# Altium schematic sheet Sheet5.SchDoc
size A3; SheetNumber: 5; SheetTotal: 6
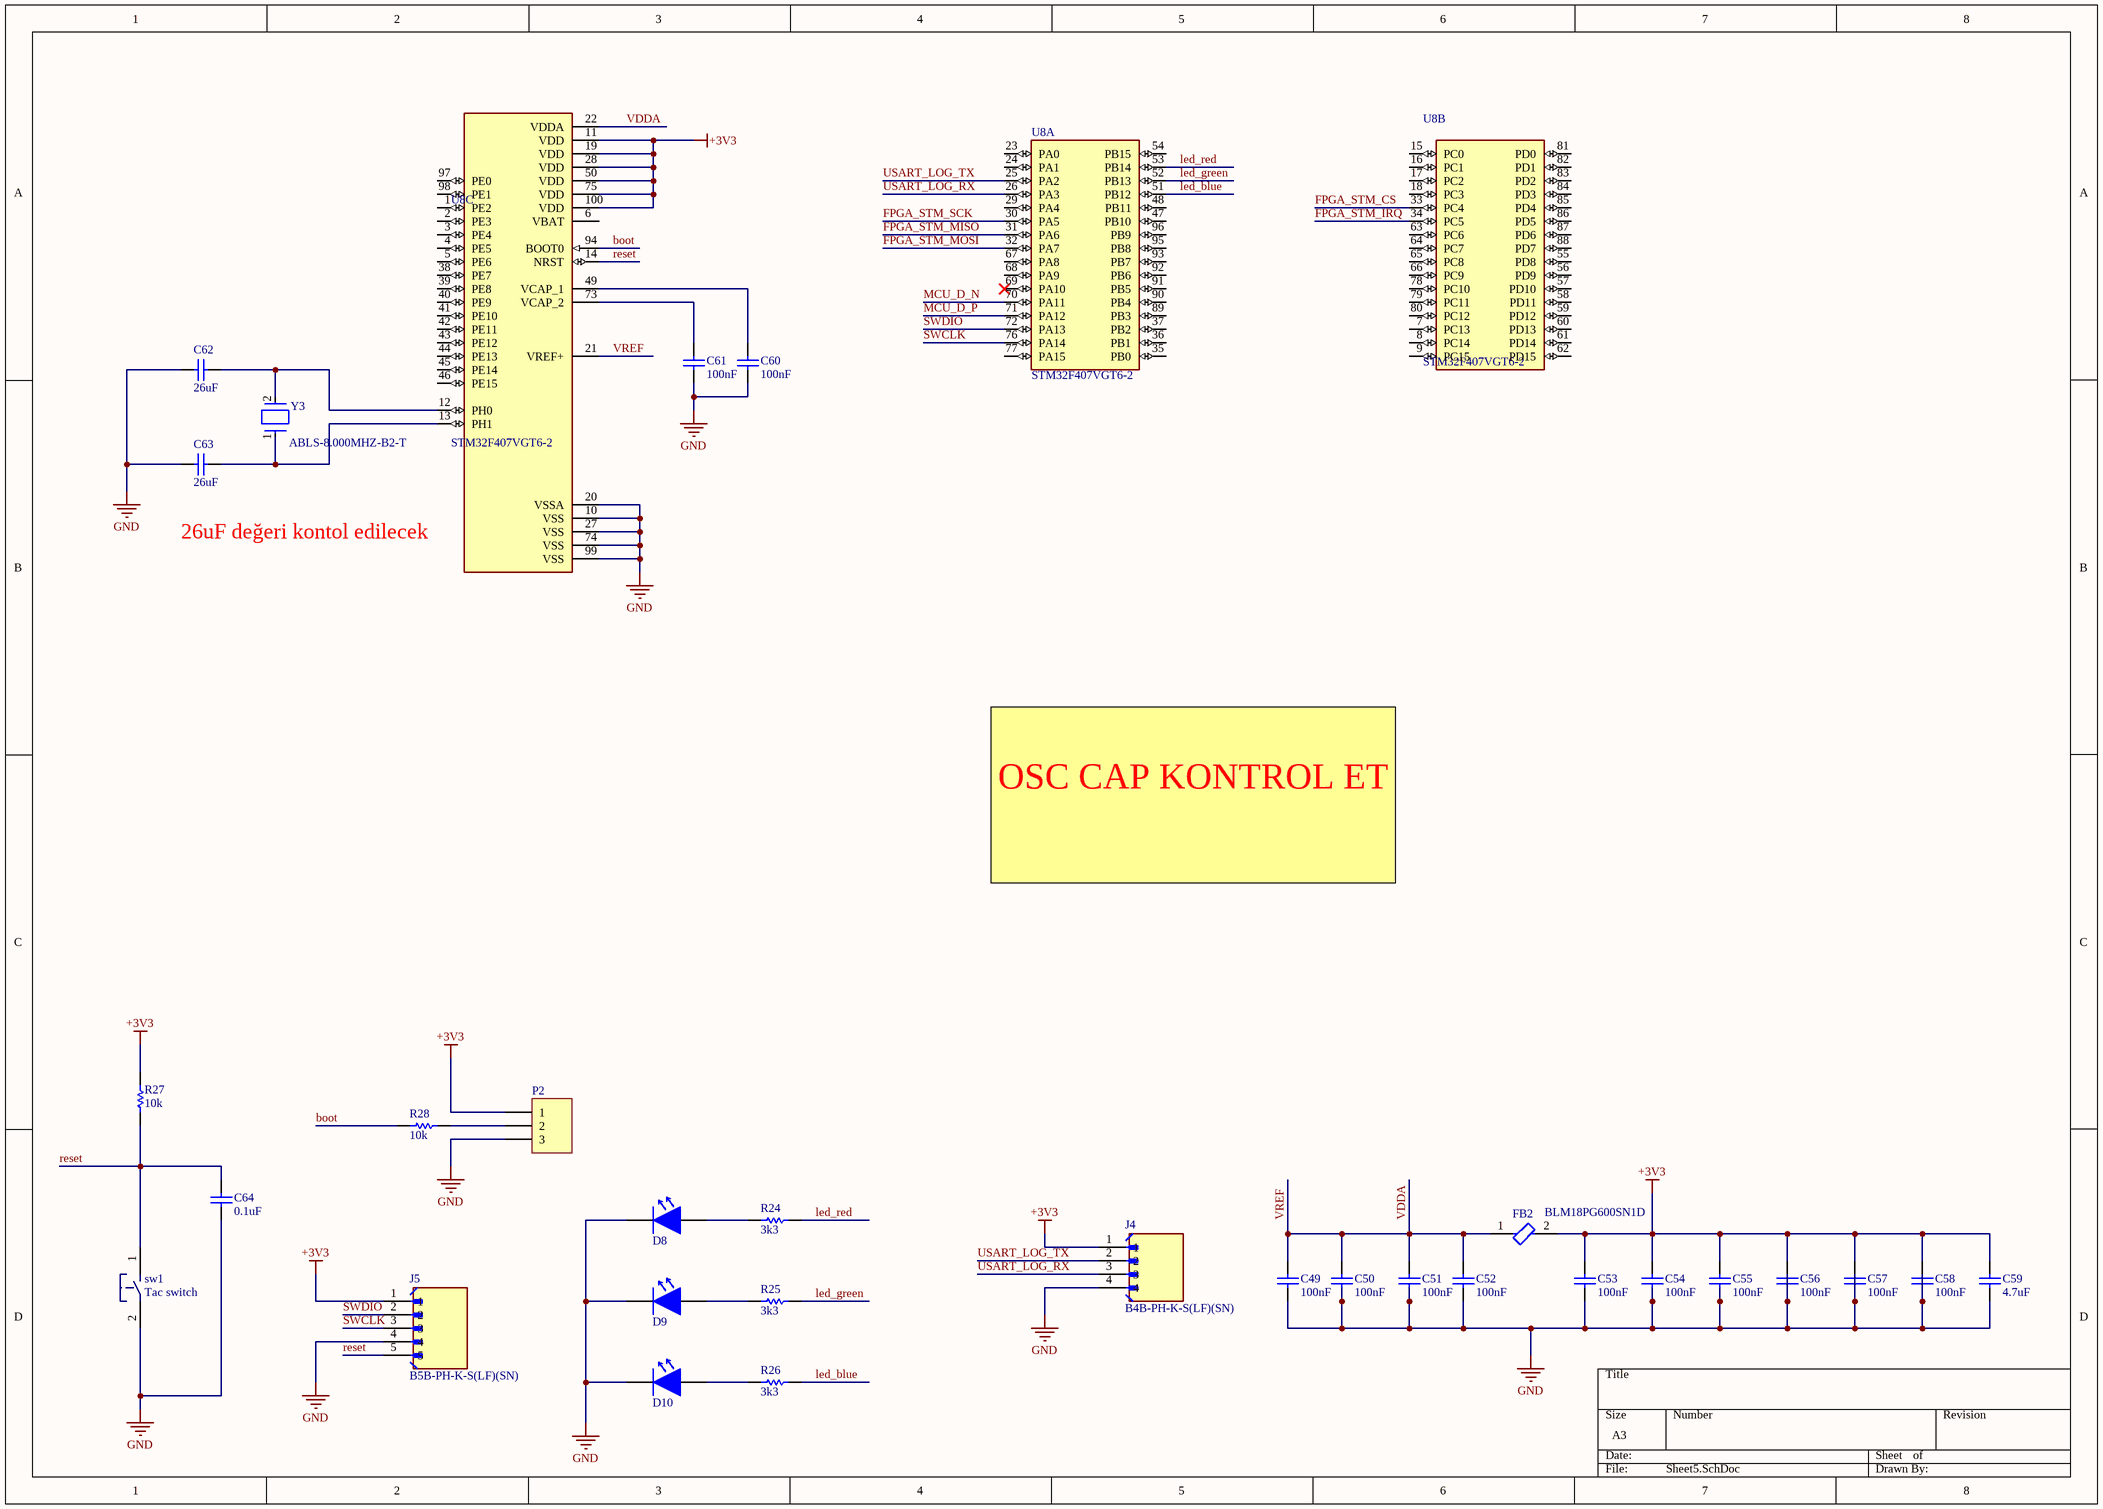
[diagram p0: Sheet5.SchDoc]

## Parts
C49  100nF  [CAPC0603(1608)100_L]
C50  100nF  [CAPC0603(1608)100_L]
C51  100nF  [CAPC0603(1608)100_L]
C52  100nF  [CAPC0603(1608)100_L]
C53  100nF  [CAPC0603(1608)100_L]
C54  100nF  [CAPC0603(1608)100_L]
C55  100nF  [CAPC0603(1608)100_L]
C56  100nF  [CAPC0603(1608)100_L]
C57  100nF  [CAPC0603(1608)100_L]
C58  100nF  [CAPC0603(1608)100_L]
C59  4.7uF  [CAPC0603(1608)100_L]
C60  100nF  [CAPC0603(1608)100_L]
C61  100nF  [CAPC0603(1608)100_L]
C62  26uF  [CAPC0603(1608)100_L]
C63  26uF  [CAPC0603(1608)100_L]
C64  0.1uF  [CAPC0603(1608)100_L]
D8  LH R974-LP-1  [LED_RED_0805]  (value not drawn)
D9  LH R974-LP-1  [LED_RED_0805]  (value not drawn)
D10  LH R974-LP-1  [LED_RED_0805]  (value not drawn)
FB2  BLM18PG600SN1D  [FP-BLM18-0_15-t0_8-IPC_B]
J4  B4B-PH-K-S(LF)(SN)  [JST_B4B-PH-K-S(LF)(SN)]
J5  B5B-PH-K-S(LF)(SN)  [JST_B5B-PH-K-S(LF)(SN)]
P2  Header 3  [My_1X03]  (value not drawn)
R24  3k3  [RESC1005X40X20NL05T10]
R25  3k3  [RESC1005X40X20NL05T10]
R26  3k3  [RESC1005X40X20NL05T10]
R27  10k  [RESC1005X40X20NL05T10]
R28  10k  [RESC1005X40X20NL05T10]
sw1  Tac switch  [MY_TACTILE-PTH]
U8  STM32F407VGT6-2  [LQFP100]  (parts A,B,C of 3)
Y3  ABLS-8.000MHZ-B2-T  [FP-ABLS-MFG]

## Nets
+3V3: C53.1 C54.1 C55.1 C56.1 C57.1 C58.1 C59.1 FB2.2 J4.1 J5.1 P2.1 R27.1 U8.11(VDD) U8.19(VDD) U8.28(VDD) U8.50(VDD) U8.75(VDD) U8.100(VDD)
GND: C49.2 C50.2 C51.2 C52.2 C53.2 C54.2 C55.2 C56.2 C57.2 C58.2 C59.2 C60.2 C61.2 C62.1 C63.1 C64.2 D8.1 D9.1 D10.1 J4.4 J5.4 P2.3 sw1.2 U8.10(VSS) U8.20(VSSA) U8.27(VSS) U8.74(VSS) U8.99(VSS)
boot: R28.1 U8.94(BOOT0)
FPGA_STM_CS: U8.33(PC4)
FPGA_STM_IRQ: U8.34(PC5)
FPGA_STM_MISO: U8.31(PA6)
FPGA_STM_MOSI: U8.32(PA7)
FPGA_STM_SCK: U8.30(PA5)
led_blue: R26.1 U8.51(PB12)
led_green: R25.1 U8.52(PB13)
led_red: R24.1 U8.53(PB14)
MCU_D_N: U8.70(PA11)
MCU_D_P: U8.71(PA12)
reset: C64.1 J5.5 R27.2 sw1.1 U8.14(NRST)
SWCLK: J5.3 U8.76(PA14)
SWDIO: J5.2 U8.72(PA13)
USART_LOG_RX: J4.3 U8.26(PA3)
USART_LOG_TX: J4.2 U8.25(PA2)
VDDA: C49.1 C50.1 C51.1 C52.1 FB2.1 U8.21(VREF+) U8.22(VDDA)  [also labelled VREF]
NetC60_1: C60.1 U8.49(VCAP_1)
NetC61_1: C61.1 U8.73(VCAP_2)
NetC62_2: C62.2 U8.12(PH0) Y3.2
NetC63_2: C63.2 U8.13(PH1) Y3.1
NetD8_2: D8.2 R24.2
NetD9_2: D9.2 R25.2
NetD10_2: D10.2 R26.2
NetP2_2: P2.2 R28.2

Not connected (* = marked no-connect by the designer): U8 1(PE2) 2(PE3) 3(PE4) 4(PE5) 5(PE6) 6(VBAT) 7(PC13) 8(PC14) 9(PC15) 15(PC0) 16(PC1) 17(PC2) 18(PC3) 23(PA0) 24(PA1) 29(PA4) 35(PB0) 36(PB1) 37(PB2) 38(PE7) 39(PE8) 40(PE9) 41(PE10) 42(PE11) 43(PE12) 44(PE13) 45(PE14) 46(PE15) 47(PB10) 48(PB11) 54(PB15) 55(PD8) 56(PD9) 57(PD10) 58(PD11) 59(PD12) 60(PD13) 61(PD14) 62(PD15) 63(PC6) 64(PC7) 65(PC8) 66(PC9) 67(PA8) 68(PA9) 69(PA10)* 77(PA15) 78(PC10) 79(PC11) 80(PC12) 81(PD0) 82(PD1) 83(PD2) 84(PD3) 85(PD4) 86(PD5) 87(PD6) 88(PD7) 89(PB3) 90(PB4) 91(PB5) 92(PB6) 93(PB7) 95(PB8) 96(PB9) 97(PE0) 98(PE1)

## Notes on the sheet
- (near U8) 26uF değeri kontol edilecek
- OSC CAP KONTROL ET

## Library data of the parts
C49-C64 = CMP-1035-02072-1: CAP 2.7nF 16V ±20% 0603 (1608 Metric) Thickness 1mm SMD; Tolerance: Â±20%; Case-Metric: 1608; Case-EIA: 0603; Rated Voltage: 16 V; Technology: SMT; Value: 2.7nF; Max Thickness: 1 mm
D8-D10 = LED RED 0805: LED Uni-Color Hyper Red 660nm 2-Pin Chip 0805(2012Metric) T/R; Manufacturer: Osram Opto; Lens Color: White; Forward Voltage: 1.8V; Lens Style: Diffused,Flat,Colorless; Luminous Intensity: 71mcd; Viewing Angle: 160°; Forward Current: 30mA; Dominant Wavelength: 645nm; Number of Elements: 1; Test Current: 20mA; Reverse Voltage: 5V; Lens Transparency: Diffused; Luminous Flux: 0.17lm; Lens Size: 1.25mm; Designed by: BERK; Supplier 1: Digi-Key; Manufacturer Part Number: LH R974-LP-1; RoHS: Yes; Category: LEDs; Stock 1: 35632; Pricing 1: 1=0,26000, 10=0,13900, 100=0,06480, 500=0,05978, 1000=0,04683, 2000=0,04584 (USD); Mount: Surface Mount; Case/Package: 0805; Number of Pins: 2; Color: Red; Case Code (Imperial): 0805; Case Code (Metric): 2012; Min Operating Temperature: -30°C; Max Operating Temperature: 85°C; Packaging: Tape and Reel; Illumination Color: Red; Package Quantity: 1; Series: CHipLED; Length: 2.1mm; Width: 1.25mm; Depth: 1.35mm; Radiation Hardening: No; RoHS Compliant: Yes; ComponentLink1URL: http://www.jameco.com/Jameco/Products/ProdDS/2085634.pdf?src-supplier=Jameco; ComponentLink1Description: http://www.jameco.com/Jameco/Products/ProdDS/2085634.pdf?src-supplier=Jameco; ComponentLink2URL: http://components.arrow.com/part/dataview/0323_01825492?src-supplier=Arrow+Europe; ComponentLink2Description: http://components.arrow.com/part/dataview/0323_01825492?src-supplier=Arrow+Europe; ComponentLink3URL: https://dammedia.osram.info/media/resource/hires/osram-dam-2493888/LH%20R974.pdf?src-supplier=Digi-Key; ComponentLink3Description: https://dammedia.osram.info/media/resource/hires/osram-dam-2493888/LH%20R974.pdf?src-supplier=Digi-Key; ComponentLink4URL: http://www.mouser.com/ds/2/311/LH%20R974%20-%20CHIPLED%200805-318659.pdf?src-supplier=Mouser; ComponentLink4Description: http://www.mouser.com/ds/2/311/LH%20R974%20-%20CHIPLED%200805-318659.pdf?src-supplier=Mouser; ComponentLink5URL: https://www.verical.com/server-webapp/html/getDatasheet?partID=258950&src-supplier=Verical; ComponentLink5Description: https://www.verical.com/server-webapp/html/getDatasheet?partID=258950&src-supplier=Verical; ComponentLink6URL: http://components.arrow.com/part/dataview/41971690S1077610N9133?src-supplier=Arrow+Electronics; ComponentLink6Description: http://components.arrow.com/part/dataview/41971690S1077610N9133?src-supplier=Arrow+Electronics; ComponentLink7URL: http://components.arrow.com/part/dataview/41971690S6190115N2128?src-supplier=Arrow+Electronics; ComponentLink7Description: http://components.arrow.com/part/dataview/41971690S6190115N2128?src-supplier=Arrow+Electronics; Supplier Part Number 1: 475-1415-1-ND
FB2 = CMP-0686-00575-3: Chip Ferrite Bead, 0603, 60Ω @ 100MHz, 0.1Ω, , 1A; ESR (Equivalent Series Resistance): 60R; Number of Lines: 1; Material: Steel; Tolerance: 25%; Shielding: Unshielded; Current Rating: 500mA; Resistance: 100mR; Package Quantity: 1; Termination: SMD/SMT; Lead Free: Lead Free; Max Operating Temperature: 125°C; Number of Circuits: 1; Length: 1.6mm; Min Operating Temperature: -55°C; Case Code (Metric): 1608; Max DC Current: 500mA; REACH SVHC: No SVHC; Frequency: 100MHz; Number of Pins: 2; RoHS Compliant: Yes; Height: 0.8mm; Depth: 0.8mm; Width: 0.8mm; Test Frequency: 100MHz; Case/Package: 0603; Impedance: 60R; Max Current Rating: 500mA; Packaging: Tape and Reel; DC Resistance (DCR): 100mR; Case Code (Imperial): 0603; Core Material: Ferrite
J4 = B4B-PH-K-S(LF)(SN): Connector Header Through Hole 4 position 0.079 (2.00mm); MF: JST Sales; SnapEDA_Link: https://www.snapeda.com/parts/B4B-PH-K-S%20(LF)(SN)/JST/view-part/?ref=snap; Package: None; Value: *; MP: B4B-PH-K-S (LF)(SN); Check_prices: https://www.snapeda.com/parts/B4B-PH-K-S%20(LF)(SN)/JST/view-part/?ref=eda
J5 = B5B-PH-K-S(LF)(SN): Conn Shrouded Header (4 Sides) HDR 5 POS 2mm Solder ST Top Entry Thru-Hole Box; MF: JST Sales America Inc.; SnapEDA_Link: https://www.snapeda.com/parts/B5B-PH-K-S(LF)(SN)/JST/view-part/?ref=snap; Package: None; Value: *; MP: B5B-PH-K-S(LF)(SN); Check_prices: https://www.snapeda.com/parts/B5B-PH-K-S(LF)(SN)/JST/view-part/?ref=eda
P2 = Header 3: Header, 3-Pin; ASiD Part Number: Header 3-AS
R24-R28 = CMP-2002-01682-1: Manufacturer: Vishay BCcomponents; Part Number: TNPW040210K0DEED
sw1 = Tac switch: small tac switch; ASiD Part Number: Tac switch-AS
Y3 = CMP-27762-009874-1: CRYSTAL 8.0000MHZ 18PF SMD; ESR (Equivalent Series Resistance): 80R; Operating Frequency: 8 MHz; Frequency Stability: 50ppm; Tolerance: 20ppm; Frequency: 8MHz; Min Operating Temperature: -20°C; Lead Free: Lead Free; Width: 4.7mm; Packaging: Tape and Reel; Series: ABLS; Accuracy: 20ppm; Length: 11.4mm; Frequency Tolerance: 20ppm; Termination: SMD/SMT; Number of Pins: 2; Radiation Hardening: No; Depth: 4.7mm; REACH SVHC: No SVHC; Contact Plating: Tin; Load Capacitance: 18pF; Case/Package: SMD/SMT; Mount: Surface Mount; Package Quantity: 1000; Max Operating Temperature: 70°C; Height: 0.165inch; Series Resistance: 80R